# EasyEDA Pro project li-chuang-kai-fa-ban-li-chuang-coloreasypico2-kai-fa-ban-7911d14e.epro, board PCB1_V1.0.4
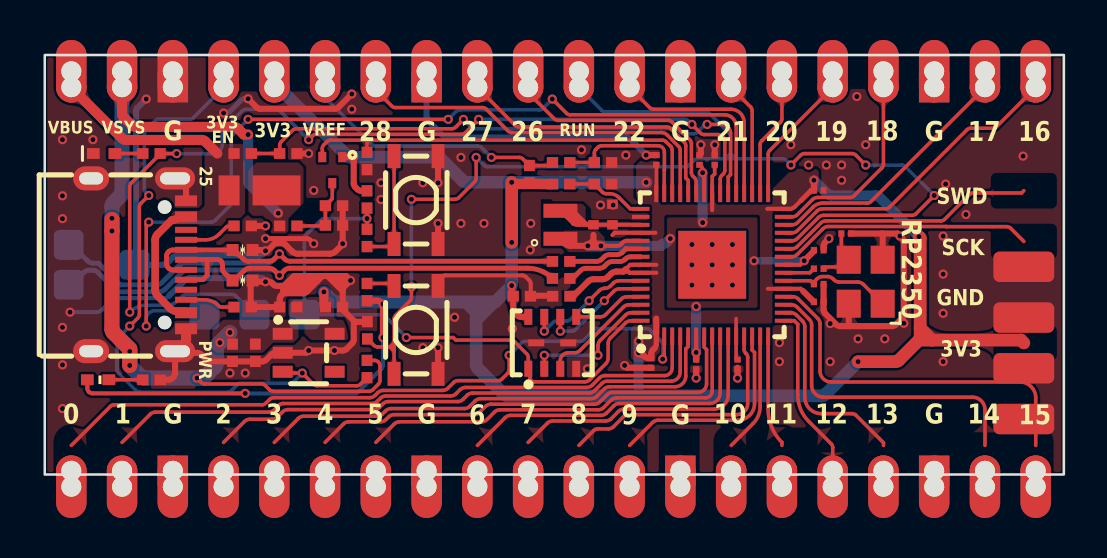
[diagram p1: board, top side]
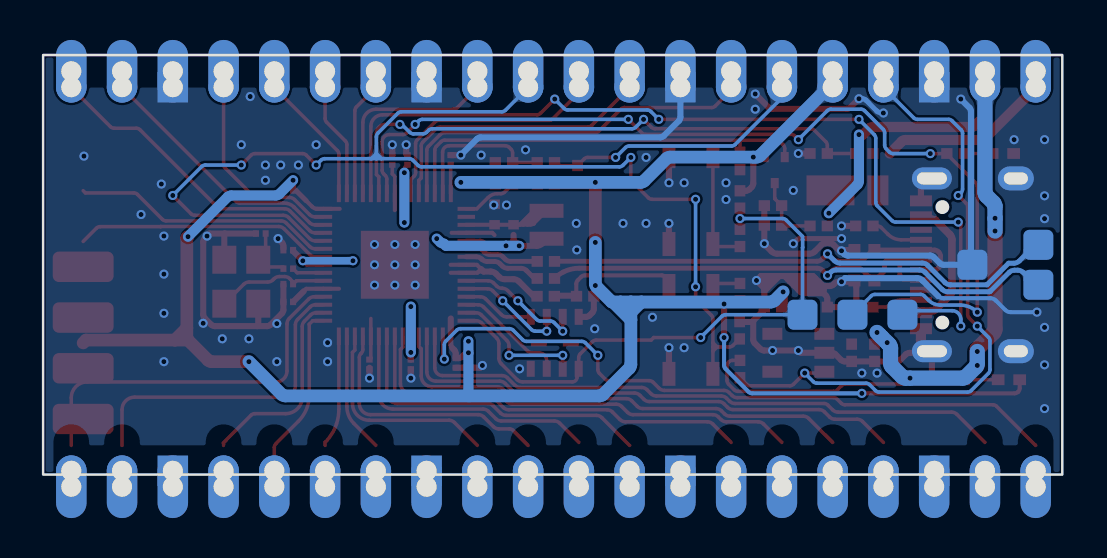
[diagram p2: board, bottom side, seen from below]

Outline 51 x 21 mm; copper layers: Top Layer, Bottom Layer. Coordinates in mm from the lower left corner of the outline.
Outline path: rectangle 0,21 51,0
Stack: Top Layer 0.035mm / Dielectric1 1.51mm FR4 er 4.5 / Bottom Layer 0.035mm

## Design rules (mm)
net USB_D-: DP2
net USB_D+: DP2
net USB2_D+: DP3
net USB2_D-: DP3
spacing copperThickness1oz (default): track to track 0.102, other pairs 0 to 0.3
spacing copperThickness2oz: track to track 0.203, other pairs 0.152 to 0.3
spacing Plane_innerPlane: track to track 0.102, other pairs 0 to 0.3
spacing Copper_copperRegion: track to track 0.102, other pairs 0 to 0.3
track width copperThickness1oz (default): min 0.102, default 0.178, max 2.54
track width VCC: min 0.102, default 0.305, max 2.54
differential pair differentialPair (default): width min 0.244, default 0.244, max 0.244; gap min 0.102, default 0.102
net GND uses VCC
net 3V3 uses VCC
net 1V1 uses VCC
pour e1417 uses Copper_copperRegion
pour e1419 uses Copper_copperRegion
pour e1421 uses Copper_copperRegion
pour e1423 uses Copper_copperRegion
pour e1425 uses Copper_copperRegion
pour e1427 uses Copper_copperRegion
pour e1429 uses Copper_copperRegion
pour e1431 uses Copper_copperRegion
pour e1433 uses Copper_copperRegion
pour e1435 uses Copper_copperRegion
pour e1437 uses Copper_copperRegion
pour e1439 uses Copper_copperRegion
pour e1441 uses Copper_copperRegion
pour e1443 uses Copper_copperRegion
pour e1445 uses Copper_copperRegion
pour e1451 uses Copper_copperRegion

## Placement (name value [footprint] x y rotation side)
BOOT1  K2-1808SN-A4SW-01  [KEY-SMD_4P-L4.2-W3.2-P2.20-LS5.1-TL]  18.58 13.74 90 top
C1  4.7uF  [C0402]  27.46 12.5 270 top
C2  100nF  [R0402]  25.85 8.93 180 top
C3  4.7uF  [C0402]  28.41 12.5 90 top
C4  4.7uF  [R0402]  27.94 14.54 0 top
C5  100nF  [R0201]  38.74 14.22 180 top
C6  100nF  [R0201]  30.61 15.75 90 top
C7  100nF  [R0402]  16.15 7.22 270 top
C8  4.7uF  [R0402]  27.94 15.62 0 top
C9  100nF  [R0201]  38.74 11.23 0 top
C10  10uF  [R0402]  14.48 8.38 180 top
C11  100nF  [R0402]  12.19 8.38 0 top
C12  10uF  [R0402]  9.4 6.1 90 top
C13  100nF  [R0402]  10.54 6.1 90 top
C14  100nF  [R0201]  38.74 8.64 0 top
C15  100nF  [R0201]  33.53 15.75 270 top
C16  100nF  [R0201]  32.77 15.75 270 top
C17  100nF  [R0201]  34.67 5.51 270 top
C18  100nF  [R0201]  32.6 5.51 270 top
C19  100nF  [R0201]  30.35 5.59 270 top
C21  100nF  [R0402]  14.48 12.48 180 top
C22  15pF  [R0201]  38.74 9.53 180 top
C23  15pF  [R0201]  40.11 12.06 0 top
C24  100nF  [R0402]  23.88 8.93 180 top
D1  DFLS130L-7  [POWERDI-123_L2.8-W1.8-LS3.7-RD]  10.41 14.22 180 top
D2  RCLAMP0521P.TCT-MS  [D0402-BI]  9.9 11.24 180 top
D3  RCLAMP0521P.TCT-MS  [D0402-BI]  9.9 9.72 180 top
H1  2.54-1*4  [HDR-TH_4P-P2.54-V-M-1]  49 10.4 270 top
J1  -  [半孔-孔-20P-2.54-1.27-无丝印#2]  25.46 0 0 top
J2  -  [半孔-孔-20P-2.54-1.27-无丝印]  25.46 21 0 top
L2  AOTA-B201610S3R3-101-T  [IND-SMD_L2.0-W1.6_AOTA-B201610S3R3-101-T]  25.81 12.5 90 top
LED1  XL-1005UGC  [LED0402-RD_GREEN]  2.97 16.07 0 top
PWR_LED  NCD0402R1  [LED0402-RD]  2.67 4.75 180 top
Q1  DMG1012T-7  [SOT-523-3_L1.6-W0.8-P1.00-LS1.6-BR]  14.39 15.24 90 top
R1  15kΩ  [R0402]  5.34 16.07 180 top
R2  5.1kΩ  [R0402]  9.91 12.45 0 top
R3  5.6kΩ  [R0402]  9.91 16.07 180 top
R4  27Ω  [R0402]  25.84 10.67 0 top
R5  27Ω  [R0402]  25.84 9.82 0 top
R6  10kΩ  [R0402]  12.19 16.07 180 top
R7  33Ω  [R0402]  25.84 14.54 180 top
R8  5.1kΩ  [R0402]  9.91 8.38 0 top
R9  10kΩ  [R0402]  16.13 9.13 90 top
R10  1Ω  [R0402]  25.84 15.62 180 top
R11  100kΩ  [R0402]  16.13 5.28 270 top
R12  2kΩ  [R0402]  5.34 4.75 0 top
R13  NC  [R0402]  16.13 13.77 90 top
R14  1kΩ  [R0402]  16.13 11.84 90 top
R15  100kΩ  [R0402]  12.19 12.45 180 top
R16  100kΩ  [R0402]  14.48 13.46 180 top
R17  100kΩ  [R0402]  16.13 15.7 90 top
R18  1kΩ  [R0201]  38.74 10.31 0 top
R19  200Ω  [R0402]  24.26 15.04 270 top
SW1  K2-1808SN-A4SW-01  [KEY-SMD_4P-L4.2-W3.2-P2.20-LS5.1-TL]  18.58 7.24 90 top
TP1  TP-红色测试点  [TESTPOINT-TH_BD3.2]  4.5 10.5 270 bottom
TP2  TP-红色测试点  [TESTPOINT-TH_BD3.2]  1.2 11.5 0 bottom
TP3  TP-红色测试点  [TESTPOINT-TH_BD3.2]  1.2 9.5 0 bottom
TP4  TP-红色测试点  [TESTPOINT-TH_BD3.2]  8 8 270 bottom
TP5  TP-红色测试点  [TESTPOINT-TH_BD3.2]  10.5 8 270 bottom
TP6  TP-红色测试点  [TESTPOINT-TH_BD3.2]  13 8 270 bottom
U1  RP2350A  [QFN-60_L7.0-W7.0-P0.40-TL-EP3.4]  33.4 10.5 90 top
U3  ME6217C33M5G  [SOT-23-5_L3.0-W1.7-P0.95-LS2.8-BR]  13.21 6.1 180 top
U4  W25Q32JVUUIQ  [USON-8_L4.0-W3.0-P0.80-BL_WINBOND_UU]  25.4 6.59 0 top
USB1  TYPE-C 16PIN 2MD(073)  [USB-C-SMD_TYPE-C-6PIN-2MD-073]  4.7 10.5 270 top
X1  ABM8-272-T3  [CRYSTAL-SMD_4P-L3.2-W2.5-BL]  41.08 9.65 90 top

## Footprints (pads in the part's own frame, mm; a bottom-side part is the same pattern mirrored in y, then rotated)
C0402
  rect 0.47x0.531 smd: 1(0,0) 2(1.031,0)
CRYSTAL-SMD_4P-L3.2-W2.5-BL
  rect 1.4x1.2 smd: 1(-1.1,-0.85) 2(1.1,-0.85) 3(1.1,0.85) 4(-1.1,0.85)
D0402-BI
  rect 0.6x0.6 smd: 1(-0.5,0) 2(0.5,0)
HDR-TH_4P-P2.54-V-M-1
  rrect 1.524x3.048 smd: 1(0,0) 2(2.54,0) 3(5.08,0) 4(7.62,0)
IND-SMD_L2.0-W1.6_AOTA-B201610S3R3-101-T
  rect 0.7x1.7 smd: 1(0.7,0) 2(-0.7,0)
KEY-SMD_4P-L4.2-W3.2-P2.20-LS5.1-TL
  rect 1.2x0.65 smd: 1(-2.2,1.1) 2(2.2,1.1) 3(-2.2,-1.1) 4(2.2,-1.1)
LED0402-RD
  rect 0.636x0.54 smd: 1(-0.538,0) 2(0.538,0)
LED0402-RD_GREEN
  rect 0.636x0.54 smd: 1(-0.538,0) 2(0.538,0)
POWERDI-123_L2.8-W1.8-LS3.7-RD
  rect 2.4x1.5 smd: 1(-1.188,0)
  rect 1.05x1.5 smd: 2(1.188,0)
QFN-60_L7.0-W7.0-P0.40-TL-EP3.4
  rect 0.875x0.2 smd: 1(-3.575,2.8) 2(-3.575,2.4) 3(-3.575,2) 4(-3.575,1.6) 5(-3.575,1.2) 6(-3.575,0.8) 7(-3.575,0.4) 8(-3.575,0) 9(-3.575,-0.4) 10(-3.575,-0.8) 11(-3.575,-1.2) 12(-3.575,-1.6) 13(-3.575,-2) 14(-3.575,-2.4) 15(-3.575,-2.8) 31(3.575,-2.8) 32(3.575,-2.4) 33(3.575,-2.001) 34(3.575,-1.6) 35(3.575,-1.2) 36(3.575,-0.8) 37(3.575,-0.4) 38(3.575,-0.001) 39(3.575,0.4) 40(3.575,0.8) 41(3.575,1.2) 42(3.575,1.6) 43(3.575,2) 44(3.575,2.4) 45(3.575,2.8)
  rect 0.2x0.875 smd: 16(-2.8,-3.575) 17(-2.4,-3.575) 18(-2,-3.575) 19(-1.6,-3.575) 20(-1.2,-3.575) 21(-0.8,-3.575) 22(-0.4,-3.575) 23(0,-3.575) 24(0.4,-3.575) 25(0.8,-3.575) 26(1.2,-3.575) 27(1.6,-3.575) 28(2,-3.575) 29(2.4,-3.575) 30(2.8,-3.575) 46(2.8,3.575) 47(2.4,3.575) 48(2,3.575) 49(1.6,3.575) 50(1.2,3.575) 51(0.8,3.575) 52(0.4,3.575) 53(0,3.575) 54(-0.4,3.575) 55(-0.8,3.575) 56(-1.2,3.575) 57(-1.6,3.575) 58(-2,3.575) 59(-2.4,3.575) 60(-2.8,3.575)
  rect 3.4x3.4 smd: 61(0,0)
R0201
  rect 0.303x0.324 smd: 1(-0.241,0) 2(0.241,0)
R0402
  rect 0.566x0.54 smd: 1(-0.433,0) 2(0.433,0)
SOT-23-5_L3.0-W1.7-P0.95-LS2.8-BR
  rect 1x0.6 smd: 1(1.3,-0.95) 2(1.3,0) 3(1.3,0.95) 4(-1.3,0.95) 5(-1.3,-0.95)
SOT-523-3_L1.6-W0.8-P1.00-LS1.6-BR
  rect 0.51x0.4 smd: 1(0.65,-0.5) 2(0.65,0.5) 3(-0.65,0)
TESTPOINT-TH_BD3.2
  rrect 1.5x1.5 smd: 1(0,0)
USB-C-SMD_TYPE-C-6PIN-2MD-073
  rect 0.55x1.1 smd: 1(-3.2,2.375) 2(-2.4,2.375) 11(2.4,2.375) 12(3.2,2.375)
  rect 0.3x1.1 smd: 3(-1.75,2.375) 4(-1.25,2.375) 5(-0.75,2.375) 6(-0.25,2.375) 7(0.25,2.375) 8(0.75,2.375) 9(1.25,2.375) 10(1.75,2.375)
  oval 1.1x2 hole 0.6x1.5: 13(-4.325,1.825) 14(4.325,1.825)
  oval 1.2x1.8 hole 0.6x1.2: 13(-4.325,-2.375) 14(4.325,-2.375)
USON-8_L4.0-W3.0-P0.80-BL_WINBOND_UU
  rect 0.4x0.8 smd: 1(-1.2,-1.3) 2(-0.4,-1.3) 3(0.4,-1.3) 4(1.2,-1.3) 5(1.2,1.3) 6(0.4,1.3) 7(-0.4,1.3) 8(-1.2,1.3)
  rect 0.8x0.35 smd: 9(-0.802,0) 10(0.798,0)
半孔-孔-20P-2.54-1.27-无丝印
  oval 1.524x3.136 hole 1: 1(-24.13,-0.813) 2(-21.59,-0.813) 3(-19.05,-0.813) 4(-16.51,-0.813) 5(-13.97,-0.813) 6(-11.43,-0.813) 7(-8.89,-0.813) 8(-6.35,-0.813) 9(-3.81,-0.813) 10(-1.27,-0.813) 11(1.27,-0.813) 12(3.81,-0.813) 13(6.35,-0.813) 14(8.89,-0.813) 15(11.43,-0.813) 16(13.97,-0.813) 17(16.51,-0.813) 18(19.05,-0.813) 19(21.59,-0.813) 20(24.13,-0.813)
  round 1.524 hole 1: 1(-24.13,-1.61) 2(-21.59,-1.61) 4(-16.51,-1.61) 5(-13.97,-1.61) 6(-11.43,-1.61) 7(-8.89,-1.61) 9(-3.81,-1.61) 10(-1.27,-1.61) 11(1.27,-1.61) 12(3.81,-1.61) 14(8.89,-1.61) 15(11.43,-1.61) 16(13.97,-1.61) 17(16.51,-1.61) 19(21.59,-1.61) 20(24.13,-1.61)
  rect 1.524x1.524 hole 1: 3(-19.05,-1.61) 8(-6.35,-1.61) 13(6.35,-1.61) 18(19.05,-1.61)
半孔-孔-20P-2.54-1.27-无丝印#2
  round 1.524 hole 1: 1(-24.13,0.188) 2(-21.59,0.188) 4(-16.51,0.188) 5(-13.97,0.188) 6(-11.43,0.188) 7(-8.89,0.188) 9(-3.81,0.188) 10(-1.27,0.188) 11(1.27,0.188) 12(3.81,0.188) 14(8.89,0.188) 15(11.43,0.188) 16(13.97,0.188) 17(16.51,0.188) 19(21.59,0.188) 20(24.13,0.188)
  oval 1.524x3.136 hole 1: 1(-24.13,-0.61) 2(-21.59,-0.61) 3(-19.05,-0.61) 4(-16.51,-0.61) 5(-13.97,-0.61) 6(-11.43,-0.61) 7(-8.89,-0.61) 8(-6.35,-0.61) 9(-3.81,-0.61) 10(-1.27,-0.61) 11(1.27,-0.61) 12(3.81,-0.61) 13(6.35,-0.61) 14(8.89,-0.61) 15(11.43,-0.61) 16(13.97,-0.61) 17(16.51,-0.61) 18(19.05,-0.61) 19(21.59,-0.61) 20(24.13,-0.61)
  rect 1.524x1.524 hole 1: 3(-19.05,0.188) 8(-6.35,0.188) 13(6.35,0.188) 18(19.05,0.188)

## Nets
As in the schematic.

Pads without a net: U3 4; USB1 3 9

## Via types
v1: diameter 0.457, hole 0.254, Top Layer to Bottom Layer, 149 vias

## Routing (per net, layer and track width the routed paths; a pad name or vN(x,y) marks a point on that pad's centre or on a via; arc(x,y) is an arc through that point)
1V1: length 20.5
  Top Layer w0.203: C16.2 32.85,15.42 arc(32.91,15.34) 32.93,15.24 v1(32.93,15.11) 33,15.03 U1.39 ; 27.69,11.45 28.66,11.45 arc(28.76,11.47) 28.84,11.52 28.94,11.63 arc(29.03,11.68) 29.12,11.7 29.83,11.7 ; v1(38.01,10.7) 37.81,10.5 U1.23 ; v1(32.6,6.11) U1.6
  Top Layer w0.305: C9.1 38.49,11.19 v1(38.01,10.7) ; 27.46,12 27.46,11.73 27.29,11.56 arc(27.17,11.48) 27.02,11.45 26.3,11.45 arc(26.15,11.48) 26.03,11.56 25.81,11.78 ; C18.1 v1(32.6,6.11)
  Bottom Layer w0.381: v1(38.01,10.7) v1(35.5,10.7)
  Bottom Layer w0.508: v1(32.93,15.11) v1(32.93,12.61) ; 27.84,11.45 27.83,11.45 v1(27.18,11.45) ; v1(27.84,11.45) 30.84,11.45 30.95,11.56 arc(31.04,11.58) 31.13,11.63 v1(31.31,11.81) ; v1(32.6,8.41) v1(32.6,6.11)
3V3: length 136.9
  Top Layer w0.178: 33.4,14.19 33.4,14.92 33.53,15.05 C15.2 ; C17.1 34.6,5.82 34.6,7.81 ; C6.1 30.61,14.08 U1.45 ; 30.6,7.03 30.61,7.03
  Top Layer w0.201: 29.83,12.1 30.56,12.1
  Top Layer w0.203: 30.61,10.1 U1.54 29.27,10.1 29.21,10.16 ; 29.21,10.16 28.96,10.16 ; 29.21,10.16 29.08,10.29 29.3,10.5 U1.53 30.61,10.5 ; 37.85,13.72 37.54,13.41 arc(37.42,13.33) 37.27,13.3 U1.30 36.16,13.3 ; U1.38 33.4,13.23 ; 29.83,12.1 28.52,12.1 28.41,11.99 ; v1(10.03,4.06) 2.39,4.06 arc(2.29,4.08) 2.21,4.14 2.21,4.14 arc(2.15,4.23) 2.13,4.32 2.13,4.75 ; 37.96,9.17 37.83,9.3 U1.20 36.19,9.3
  Top Layer w0.254: C5.2 38.35,14.22 37.85,13.72 ; 30.6,7.03 30.6,6.51 arc(30.58,6.42) 30.53,6.33
  Top Layer w0.305: 30.6,7.03 30.6,7.81 ; 16.93,6.89 16.93,8.43 arc(16.91,8.53) 16.85,8.61 16.84,8.63 arc(16.76,8.68) 16.66,8.7 R9.1 ; 16.93,6.89 v1(16.93,6.86) ; 16.93,6.89 16.89,6.86 ; 13.97,8.46 14.04,8.38 ; v1(23.37,9.46) 23.37,9.03 23.44,8.95 23.44,8.28 arc(23.46,8.19) 23.52,8.11 23.66,7.97 arc(23.74,7.91) 23.84,7.89 U4.8 ; 37.96,9.17 38.49,8.64 ; 29.08,10.29 28.96,10.16 28.61,10.16 arc(28.46,10.13) 28.34,10.05 28.18,9.89 arc(28.05,9.81) 27.91,9.78 27.46,9.78 arc(27.32,9.75) 27.19,9.67 26.45,8.93 C2.1 ; R13.2 15.83,14.2 arc(15.74,14.22) 15.66,14.28 15.54,14.4 arc(15.48,14.48) 15.46,14.58 15.46,15.64 arc(15.44,15.73) 15.39,15.82 arc(15.31,15.87) 15.21,15.89 Q1.1 ; 30.53,6.33 30.43,6.23 arc(30.37,6.15) 30.35,6.05 C19.1 30.21,5.83 arc(30.11,5.85) 30.03,5.9 29.94,5.99 29.82,5.99 v1(29.72,6.1) ; C5.2 v1(38.49,14.73)
  Top Layer w0.457: v1(13.97,9.14) 13.97,8.46
  Top Layer w0.508: v1(23.37,14.63) 23.45,14.54 R7.2
  Top Layer w0.635: 44.41,6.73 48.85,6.73 49,6.59 ; 44.41,6.73 43.75,6.73 ; 44.41,6.73 43.81,7.33 ; v1(23.37,14.63) v1(23.37,11.62) ; 43.75,6.73 43.81,6.79 43.81,7.33 ; 43.75,6.73 42.75,5.73 arc(42.66,5.67) 42.57,5.65 v1(40.7,5.65) ; v1(43.75,11.91) 43.81,11.85 43.81,7.33
  Bottom Layer w0.203: v1(16.93,6.86) 16.93,5.47 arc(16.91,5.38) 16.85,5.29 15.7,4.14 arc(15.61,4.08) 15.52,4.06 v1(10.03,4.06)
  Bottom Layer w0.508: v1(43.75,11.91) 41.77,13.9 arc(41.68,13.95) 41.59,13.97 39.36,13.97 arc(39.26,13.99) 39.18,14.04 v1(38.49,14.73) ; v1(29.72,6.67) v1(29.72,6.1) 29.72,3.97 29.69,3.94
  Bottom Layer w0.635: v1(30.1,14.63) v1(23.37,14.63) 21.1,14.63 arc(21.01,14.65) 20.92,14.7 19.81,15.82 arc(19.73,15.87) 19.63,15.89 v1(15.46,15.89) 15.3,15.89 arc(15.2,15.91) 15.12,15.96 11.79,19.3 arc(11.71,19.35) 11.61,19.37 11.49,19.37 ; 21.59,8.12 21.59,7.75 ; 21.59,8.12 21.59,8.63 21.59,8.64 ; 21.59,8.12 22.11,8.64 ; 21.59,8.12 21.07,8.64 ; 21.59,7.75 21.59,5.5 arc(21.61,5.41) 21.66,5.32 22.98,4.01 arc(23.06,3.96) 23.16,3.94 38.88,3.94 arc(38.98,3.96) 39.06,4.01 v1(40.7,5.65) ; 21.59,7.75 22.48,8.64 ; 22.11,8.64 22.48,8.64 ; 22.11,8.64 21.59,8.64 ; 21.07,8.64 14.58,8.64 arc(14.49,8.66) 14.4,8.71 v1(13.97,9.14) ; 21.07,8.64 21.59,8.64 ; 22.48,8.64 22.54,8.64 23.29,9.39 arc(23.35,9.47) 23.37,9.57 v1(23.37,11.62)
  vias: v1(16.93,8.54)
3V3_EN: length 32.3
  Top Layer w0.178: R11.2 15.8,4.52 arc(15.72,4.46) 15.62,4.44 13.63,4.44 arc(13.53,4.46) 13.45,4.52 12.97,5.01 arc(12.88,5.06) 12.79,5.08 11.97,5.08 U3.3 ; v1(5.21,13.97) 4.81,13.57 arc(4.76,13.49) 4.74,13.39 4.74,8.02 arc(4.72,7.92) 4.66,7.84 v1(4.25,7.43)
  Bottom Layer w0.178: v1(12.89,5.08) 12.46,4.65 arc(12.37,4.59) 12.28,4.57 9.82,4.57 arc(9.72,4.55) 9.64,4.5 9.35,4.2 arc(9.26,4.15) 9.17,4.13 4.74,4.13 arc(4.64,4.15) 4.56,4.2 3.69,5.07 arc(3.64,5.15) 3.62,5.25 3.62,6.69 arc(3.64,6.79) 3.69,6.87 v1(4.25,7.43) ; v1(5.21,13.97) 5.07,14.11 arc(5.01,14.19) 4.99,14.29 4.99,17.08 arc(5.01,17.18) 5.07,17.26 5.51,17.71 arc(5.6,17.76) 5.69,17.78 7.25,17.78 arc(7.35,17.8) 7.43,17.85 8.95,19.37
GND: length 123.7
  Top Layer w0.203: 19.68,9.44 19.68,9.61 arc(19.7,9.71) 19.76,9.79 19.86,9.89 arc(19.95,9.95) 20.04,9.97 23.9,9.97 arc(24,9.95) 24.08,9.89 24.25,9.73 arc(24.3,9.64) 24.32,9.55 24.32,8.97 24.31,8.95
  Top Layer w0.254: v1(11.05,11.81) 13.1,11.81 arc(13.2,11.79) 13.28,11.74 v1(13.46,11.56)
  Top Layer w0.305: 11.94,9.08 12.93,9.08 arc(13.03,9.1) 13.11,9.15 13.2,9.24 ; 11.94,9.08 11.83,8.97 arc(11.78,8.88) 11.76,8.79 11.76,8.64 arc(11.68,8.46) 11.5,8.38 R8.2 10.31,8.41 10.31,9.4 arc(10.38,9.58) 10.56,9.65 v1(11.05,9.65) 11.21,9.65 arc(11.3,9.63) 11.38,9.58 11.45,9.51 arc(11.53,9.46) 11.63,9.44 11.97,9.44 ; 11.94,9.08 11.94,9.26 ; C6.2 v1(30.1,15.99) ; C16.1 32.83,16.06 v1(32.83,16.51) ; 14.91,9.47 14.6,9.78 ; 14.91,9.47 14.91,9.55 ; 14.91,9.47 14.91,9.32 ; C19.2 29.13,5.35 v1(29.02,5.46) ; 14.16,9.94 15.08,9.94 ; 14.16,9.94 13.89,9.94 ; 14.16,9.94 14.91,9.18 ; 15.08,9.94 14.99,9.84 arc(14.93,9.76) 14.91,9.66 14.91,9.55 ; 15.08,9.94 v1(15.3,9.72) ; 38.98,9.51 C14.2 38.98,8.25 arc(39,8.15) 39.05,8.07 39.61,7.5 arc(39.7,7.45) 39.79,7.43 40.28,7.43 ; USB1.1 7.07,14.28 arc(6.91,14.66) USB1.13 ; X1.2 41.93,12.05 41.92,12.06 ; 12.01,9.48 12.18,9.65 12.19,9.65 12.36,9.82 ; 12.01,9.48 13.43,9.48 ; 12.01,9.48 11.97,9.44 ; 13.43,9.48 13.2,9.24 ; 13.43,9.48 13.62,9.66 ; 13.2,9.24 13.17,9.26 11.94,9.26 ; 12.36,9.82 12.44,9.74 arc(12.53,9.68) 12.62,9.66 13.62,9.66 ; 12.36,9.82 12.48,9.94 13.58,9.94 ; 14.91,9.18 14.91,9.32 ; 14.91,9.18 C10.1 14.91,8.25 15.47,7.7 ; 14.91,9.32 v1(15.3,9.72) ; 13.58,9.94 13.89,9.94 ; 13.58,9.94 13.74,9.78 13.89,9.94 ; 13.62,9.66 13.74,9.78 ; 15.47,7.7 15.47,6.75 arc(15.45,6.66) 15.39,6.57 15.1,6.28 arc(15.02,6.23) 14.92,6.21 v1(14.5,6.21) v1(13.21,6.21) 13.09,6.1 11.53,6.1 arc(11.44,6.08) 11.36,6.02 11.07,5.74 arc(10.99,5.68) 10.89,5.66 C13.1 C12.1 8.28,5.66 arc(8.19,5.68) 8.11,5.74 7.83,6.01 arc(7.75,6.07) 7.65,6.09 6.52,6.09 6.52,5.07 arc(6.5,4.98) 6.45,4.89 6.38,4.82 arc(6.29,4.76) 6.2,4.75 R12.2 ; 15.47,7.7 15.53,7.64 16.17,7.64 ; 38.98,11.3 38.98,11.44 arc(39,11.54) 39.05,11.62 v1(39.24,11.81) ; C23.2 41.92,12.06 ; 41.92,12.06 42.67,12.06 v1(42.8,11.94) 42.91,11.82 arc(42.97,11.74) 42.99,11.64 42.99,8.01 arc(42.97,7.91) 42.91,7.83 42.59,7.5 arc(42.51,7.45) 42.41,7.43 40.28,7.43 ; C18.2 v1(32.6,4.83) ; 11.97,9.44 11.94,9.41 11.94,9.26 ; X1.4 40.23,7.48 40.28,7.43 ; v1(15.3,9.72) 15.18,9.72 arc(15.08,9.7) 15,9.64 14.91,9.55 ; v1(15.37,19.05) 14.7,18.38 arc(14.61,18.33) 14.52,18.31 10.79,18.31 arc(10.69,18.33) 10.61,18.38 v1(10.18,18.81) ; R6.1 v1(13.21,16.07) ; 34.67,5.35 v1(34.67,4.83) ; R2.2 v1(11.05,12.45) ; 19.69,11.54 v1(19.69,12.57) ; 19.69,11.54 19.69,11.41 ; 19.69,11.54 BOOT1.3 ; 19.68,5.17 v1(19.68,6.35) ; 19.68,11.41 19.69,11.41 ; 19.69,11.41 19.69,11.24 ; 24.31,8.95 25.41,8.95 ; C15.1 v1(33.53,16.51) ; 19.68,15.81 v1(19.68,14.61) ; D2.1 11.01,11.24 v1(11.05,11.2) 11.15,11.2 11.45,11.51 arc(11.53,11.56) 11.63,11.58 11.86,11.58 arc(11.96,11.56) 12.04,11.51 12.38,11.17 arc(12.51,11.08) 12.65,11.05 14.28,11.05 arc(14.42,11.08) 14.55,11.17 14.91,11.53 v1(14.91,11.56) C21.1 R16.1
  Top Layer w0.508: 7.07,7.21 7.07,6.74 arc(7.05,6.65) 7,6.56 6.52,6.09
  Bottom Layer w0.203: v1(1.27,8.13) 2.59,8.13 arc(2.73,8.16) 2.86,8.24 3.33,8.71 arc(3.45,8.8) 3.6,8.83 5.95,8.83 arc(6.09,8.85) 6.22,8.94
  Bottom Layer w0.254: v1(8.95,18.1) 8.98,18.12 9.1,18.12 arc(9.2,18.14) 9.28,18.2 9.82,18.74 arc(9.91,18.79) 10,18.81 v1(10.18,18.81)
  Bottom Layer w0.305: v1(5.08,18.8) 4.65,18.36 arc(4.59,18.28) 4.57,18.18 4.57,10.57 TP1.1 5.95,10.5 arc(6.04,10.52) 6.13,10.58 6.44,10.89 arc(6.52,10.94) 6.62,10.96 10.73,10.96 arc(10.83,10.98) 10.91,11.04 10.91,11.06 v1(11.05,11.2) ; 6.22,8.94 7,9.72 arc(7.12,9.8) 7.27,9.83 10.87,9.83 v1(11.05,9.65) ; 19.11,19.37 19.11,17.89 arc(19.13,17.79) 19.19,17.71 19.94,16.95 arc(20.02,16.9) 20.12,16.88 29.1,16.88 arc(29.2,16.86) 29.28,16.8 v1(30.1,15.99)
  vias: v1(0.89,16.76) v1(0.89,13.95) v1(0.89,12.81) v1(0.89,7.37) v1(0.89,5.49) v1(0.89,3.3) v1(2.41,16.76) v1(9.27,5.08) v1(10.03,5.08) v1(13.46,14.22) v1(15.37,18.29) v1(16.83,14.61) v1(16.83,13.77) v1(18.92,14.61) v1(18.92,6.35) v1(20.51,7.87) v1(20.83,15.88) v1(20.83,12.57) v1(21.98,12.57) v1(23.4,7.3) v1(24.32,12.57) v1(24.3,11.25) v1(26.86,16.26) v1(27.16,5.29) v1(27.81,13.49) v1(28.45,13.49) v1(29.08,15.99) v1(32.38,11.52) v1(32.38,10.5) v1(32.38,9.48) v1(33.4,11.52) v1(33.4,10.5) v1(33.4,9.48) v1(34.42,11.52) v1(34.42,10.5) v1(34.42,9.48) v1(36.77,6.6) v1(36.77,5.65) v1(37.34,16.51) v1(38.23,15.49) v1(39.12,15.49) v1(39.31,7.56) v1(39.31,5.65) v1(39.88,15.49) v1(39.88,14.73) v1(40.64,18.92) v1(40.7,6.79) v1(41.08,16.51) v1(42.04,6.79) v1(42.99,7.57) v1(44.96,11.94) v1(44.96,10.03) v1(44.96,8.07) v1(44.96,5.65) v1(45.09,14.54) v1(46.1,13.02) v1(48.96,15.94)
VBUS: length 15.3
  Top Layer w0.381: USB1.11 6.99,8.18 6.57,8.18 arc(6.43,8.21) 6.3,8.29 5.64,8.96 arc(5.55,9.08) 5.52,9.23 5.52,11.75 arc(5.55,11.9) 5.64,12.02 6.35,12.74 6.46,12.74 arc(6.54,12.79) 6.64,12.81 7.07,12.81
  Top Layer w0.508: 8.64,16.07 8.03,16.67 arc(7.95,16.73) 7.85,16.75 4.06,16.75 arc(3.96,16.77) 3.88,16.82 1.33,19.37
ADC_VREF: length 13.3
  Top Layer w0.178: R10.2 25.33,15.54 arc(25.25,15.49) 25.15,15.47 24.36,15.47 arc(24.26,15.49) 24.18,15.54 23.93,15.8 arc(23.84,15.86) 23.75,15.88 v1(22.35,15.88)
  Bottom Layer w0.178: v1(22.35,15.88) 21.85,16.37 arc(21.77,16.43) 21.68,16.45 16.55,16.45 arc(16.45,16.47) 16.37,16.52 14.11,18.79 arc(14.05,18.87) 14.03,18.97 14.03,19.37
GPIO0: length 34.7
  Top Layer w0.178: 1.33,1.46 3.29,3.42 arc(3.37,3.47) 3.47,3.49 10.88,3.49 arc(10.98,3.51) 11.06,3.57 11.27,3.77 arc(11.35,3.83) 11.45,3.85 16.26,3.85 arc(16.41,3.88) 16.53,3.96 16.67,4.1 arc(16.79,4.18) 16.94,4.21 19.91,4.21 arc(20.06,4.24) 20.18,4.32 20.48,4.62 arc(20.56,4.68) 20.66,4.7 22.69,4.7 arc(22.79,4.72) 22.87,4.77 23.17,5.07 arc(23.22,5.15) 23.24,5.25 v1(23.24,5.97) ; v1(30.92,5.78) 31,5.86 31,7.03
  Bottom Layer w0.178: v1(23.24,5.97) 23.87,6.59 arc(23.95,6.65) 24.04,6.67 26.82,6.67 arc(26.92,6.69) 27,6.74 27.48,7.23 arc(27.57,7.28) 27.66,7.3 30.12,7.3 arc(30.22,7.28) 30.3,7.23 30.85,6.68 arc(30.91,6.6) 30.92,6.5 v1(30.92,5.78)
GPIO1: length 30.6
  Top Layer w0.178: U1.3 31.4,5.34 arc(31.29,5.07) 31.02,4.95 28.04,4.95 arc(27.89,4.92) 27.77,4.84 27.4,4.47 arc(27.27,4.39) 27.13,4.36 21.05,4.36 arc(20.91,4.33) 20.78,4.25 20.58,4.04 arc(20.46,3.96) 20.31,3.93 17.07,3.93 arc(16.92,3.9) 16.8,3.82 16.65,3.67 arc(16.52,3.58) 16.38,3.56 11.92,3.56 arc(11.82,3.54) 11.74,3.48 11.49,3.24 arc(11.37,3.15) 11.22,3.12 5.54,3.12 arc(5.4,3.09) 5.27,3.01 3.87,1.61
GPIO2: length 26
  Top Layer w0.178: 31.8,6.92 31.8,5.14 arc(31.67,4.81) 31.34,4.67 28.15,4.67 arc(28.01,4.65) 27.88,4.56 27.51,4.19 arc(27.39,4.11) 27.24,4.08 21.41,4.08 arc(21.26,4.05) 21.14,3.97 20.94,3.76 arc(20.81,3.68) 20.67,3.65 17.2,3.65 arc(17.05,3.62) 16.93,3.54 16.75,3.36 arc(16.62,3.28) 16.48,3.25 12.17,3.25 arc(12.03,3.22) 11.9,3.14 11.64,2.88 arc(11.52,2.8) 11.37,2.77 10.27,2.77 arc(10.12,2.74) 10,2.66 8.95,1.61
GPIO3: length 24
  Top Layer w0.178: 11.49,1.61 12.69,2.81 arc(12.81,2.89) 12.96,2.92 16.63,2.92 arc(16.78,2.95) 16.9,3.03 17.06,3.19 arc(17.18,3.27) 17.33,3.3 21,3.3 arc(21.15,3.33) 21.27,3.41 21.55,3.69 arc(21.67,3.77) 21.81,3.8 27.36,3.8 arc(27.5,3.83) 27.63,3.91 28,4.28 arc(28.12,4.37) 28.27,4.39 31.54,4.39 arc(31.92,4.55) 32.08,4.93 32.08,6.29 32.2,6.41 32.2,6.92
GPIO4: length 22.7
  Top Layer w0.178: U1.7 33,6.38 33.12,6.26 33.12,4.55 arc(33,4.24) 32.69,4.12 28.42,4.12 arc(28.27,4.09) 28.15,4 27.78,3.63 arc(27.65,3.55) 27.51,3.52 22.32,3.52 arc(22.18,3.49) 22.05,3.41 21.75,3.11 arc(21.63,3.03) 21.48,3 17.48,3 arc(17.33,2.97) 17.21,2.89 17.08,2.75 arc(16.96,2.67) 16.81,2.64 15.22,2.64 arc(15.07,2.61) 14.95,2.53 14.03,1.61
GPIO5: length 20.6
  Top Layer w0.178: U1.8 33.4,4.18 arc(33.3,3.94) 33.06,3.84 28.61,3.84 arc(28.46,3.81) 28.34,3.72 27.97,3.35 arc(27.84,3.27) 27.7,3.24 22.78,3.24 arc(22.63,3.21) 22.51,3.13 22.13,2.75 arc(22.01,2.67) 21.86,2.64 17.76,2.64 arc(17.61,2.61) 17.49,2.53 16.57,1.61
GPIO6: length 16.1
  Top Layer w0.178: 21.65,1.46 23.04,2.85 arc(23.17,2.93) 23.31,2.96 27.84,2.96 arc(27.99,2.99) 28.11,3.07 28.48,3.44 arc(28.6,3.53) 28.75,3.56 33.28,3.56 arc(33.65,3.71) 33.8,4.08 33.8,6.92
GPIO7: length 14
  Top Layer w0.178: 24.19,1.61 25.15,2.57 arc(25.28,2.65) 25.42,2.68 28.08,2.68 arc(28.22,2.71) 28.35,2.79 28.72,3.17 arc(28.84,3.25) 28.99,3.28 33.5,3.28 arc(33.99,3.48) 34.2,3.98 34.2,6.92
GPIO8: length 12.8
  Top Layer w0.178: U1.12 35,6.26 arc(35.02,6.16) 35.08,6.08 35.1,6.05 arc(35.16,5.97) 35.18,5.87 35.18,3.56 arc(35.02,3.16) 34.62,3 29.22,3 arc(29.08,2.97) 28.95,2.89 28.47,2.4 arc(28.34,2.31) 28.2,2.29 27.66,2.29 arc(27.57,2.27) 27.48,2.21 26.73,1.46
GPIO9: length 10.6
  Top Layer w0.178: U1.13 35.4,6.23 35.52,6.11 35.52,3.56 arc(35.27,2.97) 34.68,2.72 30.69,2.72 arc(30.54,2.69) 30.42,2.61 29.27,1.46
GPIO10: length 6
  Top Layer w0.178: 35.8,6.92 35.8,3.41 arc(35.71,2.95) 35.45,2.56 34.35,1.46
GPIO11: length 5.6
  Top Layer w0.178: 36.2,6.92 36.2,3.28 arc(36.23,2.91) 36.32,2.54 arc(36.55,2.04) 36.89,1.61 ; 36.89,1.61 36.89,1.46
GPIO12: length 8.1
  Top Layer w0.178: 39.43,0.83 39.43,1.36 arc(39.41,1.45) 39.36,1.53 38.23,2.66 arc(37.83,3.27) 37.69,3.98 37.69,7.52 37.51,7.7 U1.16
GPIO13: length 10.1
  Top Layer w0.178: U1.17 37.35,8.1 arc(37.49,8.07) 37.62,7.99 37.93,7.68 arc(38.01,7.56) 38.04,7.41 38.04,3.88 arc(38.28,3.29) 38.87,3.05 40.41,3.05 arc(40.51,3.03) 40.59,2.97 41.97,1.59 41.97,1.46
GPIO14: length 16.1
  Top Layer w0.178: U1.18 37.37,8.5 arc(37.52,8.47) 37.64,8.39 38.27,7.76 arc(38.35,7.64) 38.38,7.49 38.38,4.46 arc(38.55,4.05) 38.97,3.87 46.43,3.87 arc(46.87,3.69) 47.05,3.25 47.05,1.46
GPIO15: length 18.7
  Top Layer w0.178: U1.19 37.44,8.9 arc(37.59,8.87) 37.71,8.79 38.69,7.81 arc(38.77,7.69) 38.8,7.54 38.8,5.18 arc(38.96,4.8) 39.34,4.64 48.8,4.64 arc(49.36,4.4) 49.59,3.84 49.59,1.46
GPIO16: length 15.6
  Top Layer w0.178: U1.27 37.4,12.1 arc(37.54,12.13) 37.67,12.21 38.65,13.19 arc(38.77,13.28) 38.92,13.3 42.09,13.3 arc(42.19,13.32) 42.27,13.38 46.15,17.26 arc(46.24,17.32) 46.33,17.34 47.45,17.34 arc(47.55,17.35) 47.63,17.41 49.59,19.37
GPIO17: length 12.9
  Top Layer w0.178: U1.28 37.4,12.5 arc(37.55,12.53) 37.67,12.61 38.43,13.37 arc(38.43,13.37) 38.44,13.38 arc(38.45,13.39) 38.45,13.39 arc(38.61,13.51) 38.8,13.57 arc(38.89,13.59) 38.97,13.59 41.17,13.59 arc(41.26,13.61) 41.34,13.67 47.05,19.37
GPIO18: length 9.9
  Top Layer w0.178: 41.97,19.37 41.97,15.53 arc(41.95,15.44) 41.9,15.35 40.49,13.95 arc(40.41,13.89) 40.31,13.87 38.69,13.87 arc(38.54,13.84) 38.42,13.76 37.67,13.01 arc(37.54,12.93) 37.4,12.9 U1.29
GPIO19: length 6.6
  Top Layer w0.178: 39.43,19.37 36.28,16.22 arc(36.22,16.13) 36.2,16.04 36.2,14.08
GPIO20: length 5.7
  Top Layer w0.178: 35.8,14.08 35.8,16.52 arc(35.82,16.62) 35.88,16.7 36.82,17.64 arc(36.87,17.72) 36.89,17.82 36.89,19.37
GPIO21: length 5.7
  Top Layer w0.178: U1.33 35.4,18.22 arc(35.38,18.31) 35.33,18.4 34.35,19.37
GPIO22: length 10.1
  Top Layer w0.178: U1.34 35,17.62 arc(34.81,18.09) 34.34,18.29 30.46,18.29 arc(30.36,18.31) 30.28,18.36 29.27,19.37
GPIO23: length 46.7
  Top Layer w0.178: v1(5.21,12.64) 5.08,12.51 v1(5.08,7.43) ; v1(25.4,18.8) 26.11,18.08 arc(26.2,18.03) 26.29,18.01 34.02,18.01 arc(34.43,17.84) 34.6,17.43 U1.35 ; v1(10.18,17.78) v1(20.19,17.78)
  Bottom Layer w0.178: v1(5.08,7.43) 5.08,7.77 arc(5.21,8.08) 5.51,8.2 7.8,8.2 TP4.1 ; v1(20.19,17.78) 20.59,18.18 arc(20.67,18.23) 20.77,18.25 24.75,18.25 arc(24.85,18.27) 24.93,18.32 v1(25.4,18.8) ; v1(5.21,12.64) 8.34,12.64 arc(8.44,12.66) 8.52,12.71 9.26,13.45 arc(9.32,13.53) 9.33,13.63 9.33,16.83 arc(9.35,16.93) 9.41,17.01 v1(10.18,17.78)
GPIO24: length 28.6
  Top Layer w0.178: R3.1 11.5,16.07 arc(11.68,16.15) 11.76,16.33 11.76,16.48 arc(11.78,16.58) 11.83,16.66 12.41,17.24 arc(12.49,17.29) 12.59,17.31 20.38,17.31 arc(20.48,17.33) 20.56,17.38 v1(20.96,17.78) ; 34.2,14.08 34.2,14.9 34.32,15.02 34.32,17.08 arc(34.19,17.4) 33.88,17.53 v1(33.15,17.53)
  Bottom Layer w0.178: v1(33.15,17.53) 33.05,17.53 32.65,17.13 arc(32.57,17.08) 32.47,17.06 31.99,17.06 arc(31.89,17.08) 31.81,17.13 31.71,17.24 arc(31.62,17.29) 31.53,17.31 21.53,17.31 arc(21.43,17.33) 21.35,17.38 v1(20.96,17.78)
GPIO25: length 49.3
  Top Layer w0.178: v1(21.72,17.78) 21.04,17.11 arc(20.96,17.05) 20.86,17.03 13.58,17.03 arc(13.48,17.01) 13.4,16.96 v1(13.21,16.76) ; 33.8,14.08 33.8,14.79 arc(33.82,14.88) 33.88,14.97 33.96,15.05 arc(34.02,15.14) 34.04,15.23 34.04,16.66 arc(33.93,16.91) 33.68,17.02 33,17.02 arc(32.9,17.04) 32.82,17.09 v1(32.38,17.53) ; v1(6.6,16.07) 5.78,16.07 R1.1 5.78,16.04 4.33,14.59 arc(4.27,14.51) 4.25,14.42 v1(4.25,8.13)
  Bottom Layer w0.178: v1(32.38,17.53) 32.21,17.71 arc(32.12,17.76) 32.03,17.78 v1(21.72,17.78) ; TP5.1 9.56,8.94 arc(9.48,9) 9.38,9.02 7.09,9.02 arc(6.99,9) 6.91,8.94 6.7,8.73 arc(6.42,8.55) 6.1,8.48 5.11,8.48 arc(4.65,8.39) v1(4.25,8.13) ; v1(13.21,16.76) 11.76,18.21 arc(11.68,18.27) 11.58,18.29 10.07,18.29 arc(9.98,18.27) 9.9,18.21 8.96,17.28 arc(8.91,17.2) 8.89,17.1 8.89,16.49 arc(8.87,16.39) 8.82,16.31 8.65,16.14 arc(8.56,16.08) 8.47,16.07 v1(6.6,16.07)
GPIO26/ADC0: length 12.1
  Top Layer w0.178: 24.19,19.37 24.19,19.22 arc(24.21,19.12) 24.27,19.04 25.5,17.8 arc(25.59,17.75) 25.68,17.73 31.2,17.73 arc(31.3,17.71) 31.38,17.66 32.29,16.75 arc(32.34,16.67) 32.36,16.57 32.36,15.11 arc(32.38,15.02) 32.44,14.93 32.53,14.84 arc(32.58,14.76) 32.6,14.67 U1.40
GPIO27/ADC1: length 14.1
  Top Layer w0.178: 32.2,14.08 32.2,14.73 32.08,14.85 32.08,16.46 arc(32.06,16.55) 32.01,16.64 31.32,17.32 arc(31.23,17.38) 31.14,17.4 23.73,17.4 arc(23.63,17.42) 23.55,17.47 21.65,19.37
GPIO28/ADC2: length 18.8
  Top Layer w0.178: 16.57,19.37 16.57,19.24 17.37,18.44 arc(17.45,18.39) 17.55,18.37 21.91,18.37 arc(22.01,18.35) 22.09,18.3 23.19,17.19 arc(23.27,17.14) 23.37,17.12 30.87,17.12 arc(31.02,17.09) 31.14,17.01 31.73,16.42 arc(31.78,16.34) 31.8,16.24 31.8,14.08
GPIO29/ADC3: length 21.2
  Top Layer w0.178: 16.12,16.74 30.91,16.74 arc(31.01,16.72) 31.09,16.66 31.33,16.42 arc(31.38,16.34) 31.4,16.25 U1.43 ; 16.12,16.74 14.3,16.74 arc(14.21,16.72) 14.12,16.66 13.96,16.5 arc(13.91,16.42) 13.89,16.32 Q1.2 ; 16.12,16.74 16.13,16.73 R17.2
QSPI_SCLK: length 5.6
  Top Layer w0.178: U4.6 v1(25.8,7.18) ; U1.56 28.76,9.3 arc(28.62,9.27) 28.49,9.19 v1(28,8.7)
  Bottom Layer w0.178: v1(25.8,7.18) 26.37,7.18 arc(26.47,7.19) 26.55,7.25 v1(28,8.7)
QSPI_SD0: length 3.6
  Top Layer w0.178: U1.57 29.12,8.9 arc(28.98,8.87) 28.85,8.79 28.07,8 arc(27.95,7.92) 27.8,7.89 U4.5
QSPI_SD1: length 6.7
  Top Layer w0.178: U1.59 29.34,8.1 arc(29.19,8.07) 29.07,7.99 27.8,6.72 arc(27.71,6.59) 27.69,6.45 v1(27.69,5.97) ; U4.2 v1(25,5.97)
  Bottom Layer w0.178: v1(25,5.97) v1(27.69,5.97)
QSPI_SD2: length 5.6
  Top Layer w0.178: U1.58 29.23,8.5 arc(29.09,8.47) 28.96,8.39 26.78,6.21 arc(26.66,6.12) 26.51,6.1 26.19,6.1 arc(26.05,6.07) 25.92,5.98 25.91,5.97 arc(25.83,5.85) 25.8,5.7 U4.3
QSPI_SD3: length 6.5
  Top Layer w0.178: U1.55 28.73,9.7 arc(28.58,9.67) 28.46,9.59 28.31,9.43 arc(28.18,9.35) 28.04,9.32 28.02,9.32 arc(27.88,9.29) 27.75,9.21 v1(27.24,8.7) ; U4.7 v1(25,7.18)
  Bottom Layer w0.178: v1(25,7.18) 25.43,7.61 arc(25.52,7.66) 25.61,7.68 26.12,7.68 arc(26.22,7.7) 26.3,7.76 v1(27.24,8.7)
QSPI_SS: length 29
  Top Layer w0.178: v1(18.1,6.86) 20.45,6.86 20.57,6.73 23.33,6.73 arc(23.42,6.71) 23.51,6.66 24.13,6.04 arc(24.18,5.95) 24.2,5.86 U4.1 24.28,5.21 24.28,4.87 arc(24.35,4.71) 24.51,4.64 27.01,4.64 arc(27.16,4.67) 27.28,4.75 28.08,5.55 arc(28.16,5.68) 28.19,5.82 28.19,6.56 arc(28.22,6.7) 28.31,6.83 29.07,7.59 arc(29.19,7.67) 29.34,7.7 U1.60 ; R13.1 v1(16.13,12.82) R14.2
  Bottom Layer w0.178: v1(18.1,6.86) 17.03,7.93 arc(16.95,7.98) 16.85,8 13.25,8 arc(13.07,8.08) 13,8.25 13,11.35 12.99,11.36 12.99,11.75 13,11.76 13,11.92 13.82,12.74 arc(13.9,12.8) 14,12.82 v1(16.13,12.82)
RUN: length 59.3
  Top Layer w0.178: U1.26 37.39,11.7 arc(37.54,11.73) 37.66,11.81 38.72,12.86 arc(38.84,12.95) 38.98,12.98 43.41,12.98 arc(43.51,13) 43.59,13.05 v1(44.51,13.97) ; v1(18.35,9.4) 18.35,8.87 arc(18.33,8.77) 18.28,8.69 17.56,7.97 arc(17.5,7.89) 17.48,7.79 17.48,6.6 ; 17.48,6.18 17.48,6.39 ; 17.48,6.18 SW1.1 ; 17.48,6.18 17.27,6.39 ; 17.48,6.39 17.48,6.6 ; 17.48,6.39 17.27,6.39 ; v1(21.59,15.88) 21.59,14.83 arc(21.57,14.74) 21.52,14.65 20.72,13.85 arc(20.63,13.8) 20.54,13.78 v1(18.35,13.78) ; 17.48,6.6 17.27,6.39 ; 17.27,6.39 16.66,6.39 arc(16.56,6.41) 16.48,6.46 16.23,6.71 ; v1(41.08,15.49) 40.59,15.99 arc(40.51,16.05) 40.41,16.07 38.01,16.07 arc(37.92,16.05) 37.84,15.99 v1(37.34,15.49)
  Bottom Layer w0.178: v1(21.59,15.88) 21.99,15.48 arc(22.07,15.42) 22.16,15.41 32.06,15.41 arc(32.16,15.42) 32.24,15.48 32.5,15.74 arc(32.58,15.79) 32.68,15.81 34.07,15.81 ; 34.32,16.07 34.58,15.81 ; 34.32,16.07 34.32,15.81 ; 34.32,16.07 34.32,16.07 ; 34.58,15.81 36.92,15.81 arc(37.01,15.79) 37.09,15.74 v1(37.34,15.49) 37.25,15.41 ; 34.58,15.81 34.32,15.81 ; 34.07,15.81 34.32,15.81 ; 34.07,15.81 34.32,16.07 ; v1(44.51,13.97) 43.06,15.42 arc(42.98,15.47) 42.88,15.49 v1(41.08,15.49) ; v1(18.35,9.4) v1(18.35,13.78) ; 34.32,16.07 34.32,16.91 arc(34.31,17.01) 34.25,17.09 33.25,18.09 arc(33.17,18.14) 33.07,18.16 28.05,18.16 arc(27.95,18.18) 27.87,18.24 26.73,19.37
SWCLK: length 12.9
  Top Layer w0.178: 49,11.67 48.33,12.33 arc(48.25,12.39) 48.15,12.41 45.12,12.41 45.11,12.42 39.22,12.42 arc(39.07,12.39) 38.95,12.31 37.65,11.01 arc(37.53,10.93) 37.38,10.9 U1.24
SWD: length 13.2
  Top Layer w0.178: 49,14.21 48.88,14.1 46.46,14.1 arc(46.36,14.08) 46.28,14.02 45.03,12.77 arc(44.95,12.72) 44.85,12.7 39.1,12.7 arc(38.95,12.67) 38.83,12.59 37.66,11.41 arc(37.53,11.33) 37.39,11.3 U1.25
USB2_D+: length 33.3
  Top Layer w0.244: 9.4,9.82 9.28,9.82 8.97,10.12 arc(8.92,10.2) 8.9,10.3 8.9,10.51 arc(8.88,10.6) 8.82,10.69 8.82,10.69 arc(8.74,10.74) 8.64,10.76 8.13,10.76 ; 8.13,10.76 7.07,10.76 ; 8.13,10.76 8.13,9.97 7.93,9.76 7.07,9.76 ; D3.2 9.48,9.72 9.99,10.22 arc(10.11,10.3) 10.26,10.33 11.23,10.33 arc(11.38,10.3) 11.5,10.22 v1(11.75,9.97) 12,10.22 arc(12.12,10.3) 12.26,10.33 24.17,10.33 arc(24.59,10.28) 24.97,10.14 arc(25.19,10) 25.39,9.84 arc(25.4,9.83) R5.1
  Bottom Layer w0.244: TP3.1 1.34,9.5 1.96,10.12 arc(2.09,10.2) 2.23,10.23 2.39,10.23 arc(2.54,10.2) 2.66,10.12 3.6,9.18 3.61,9.18 3.64,9.15 5.74,9.15 arc(5.89,9.18) 6.01,9.26 6.88,10.13 arc(7,10.21) 7.15,10.24 11.32,10.24 arc(11.46,10.21) 11.59,10.13 v1(11.75,9.97)
USB2_D-: length 33.5
  Top Layer w0.244: D2.2 9.48,11.24 9.94,10.79 arc(10.06,10.71) 10.2,10.68 11.22,10.68 arc(11.36,10.71) 11.49,10.79 v1(11.75,11.05) 12.01,10.79 arc(12.13,10.71) 12.28,10.68 25.4,10.68 arc(25.4,10.68) R4.1 ; 9.4,11.31 9.33,11.24 6.4,11.24 arc(6.3,11.22) 6.22,11.16 6.17,11.12 arc(6.12,11.04) 6.1,10.94 6.1,10.55 arc(6.12,10.45) 6.17,10.37 6.23,10.31 arc(6.31,10.26) 6.41,10.24 7.07,10.24
  Bottom Layer w0.244: TP2.1 1.34,11.5 2.15,10.69 arc(2.28,10.61) 2.42,10.58 2.69,10.58 ; v1(11.75,11.05) 11.4,10.7 arc(11.27,10.62) 11.13,10.59 7,10.59 arc(6.86,10.56) 6.73,10.47 5.87,9.61 arc(5.74,9.53) 5.6,9.5 3.78,9.5 3.76,9.52 3.74,9.52 2.69,10.58
USB_D+: length 3.9
  Top Layer w0.244: R5.2 26.42,9.82 26.82,10.21 arc(26.94,10.3) 27.09,10.33 27.75,10.33 arc(27.9,10.35) 28.02,10.44 28.14,10.55 arc(28.26,10.63) 28.41,10.66 28.77,10.66 arc(28.92,10.69) 29.04,10.78 29.06,10.79 arc(29.18,10.87) 29.33,10.9 U1.52
USB_D-: length 3.8
  Top Layer w0.244: U1.51 29.09,11.3 29.08,11.29 29.07,11.29 28.9,11.12 arc(28.78,11.04) 28.63,11.01 28.26,11.01 arc(28.12,10.98) 28,10.9 27.88,10.78 arc(27.76,10.7) 27.61,10.67 R4.2
VSYS: length 46.3
  Top Layer w0.178: R11.1 16.51,5.71 arc(16.61,5.7) 16.69,5.64 16.71,5.62 arc(16.76,5.54) 16.78,5.44 16.78,4.71 arc(16.76,4.61) 16.71,4.53 16.41,4.24 arc(16.33,4.18) 16.23,4.17 11.43,4.17 arc(11.34,4.18) 11.25,4.24 11.03,4.46 arc(10.95,4.51) 10.85,4.53 8.02,4.53 arc(7.92,4.55) 7.84,4.61 v1(7.62,4.83)
  Top Layer w0.508: 3.87,19.37 3.87,18.08 arc(3.89,17.98) 3.95,17.9 4.37,17.47 arc(4.45,17.42) 4.55,17.4 9.48,17.4 arc(9.58,17.38) 9.66,17.32 9.97,17.02 v1(10.18,17.02)
  Top Layer w0.762: 3.37,12.77 v1(3.37,12.19) 3.37,7.28 arc(3.38,7.19) 3.44,7.1 4.25,6.29 v1(4.25,6.16) v1(4.25,5.46)
  Bottom Layer w0.508: v1(10.18,17.02) 10.18,14.69 arc(10.2,14.6) 10.25,14.51 v1(11.68,13.08)
  Bottom Layer w0.762: v1(4.25,6.16) 4.25,5.57 arc(4.27,5.47) 4.33,5.39 4.81,4.9 arc(4.9,4.85) 4.99,4.83 v1(7.62,4.83) 7.83,4.83 arc(7.93,4.85) 8.01,4.9 8.52,5.41 arc(8.58,5.49) 8.59,5.59 8.59,6.33 arc(8.61,6.43) 8.67,6.51 v1(8.76,6.6) 9.02,6.86 arc(9.08,6.92) 9.14,6.98 v1(9.27,7.11) ; v1(3.37,12.19) v1(3.37,12.83) 3.37,13.42 arc(3.38,13.52) 3.44,13.6 3.8,13.96 arc(3.85,14.04) 3.87,14.14 3.87,19.37
XIN: length 5.7
  Top Layer w0.178: X1.1 40.96,9.52 arc(40.84,9.61) 40.69,9.64 39.77,9.64 arc(39.62,9.66) 39.5,9.75 39.45,9.8 arc(39.32,9.88) 39.18,9.91 38.92,9.91 arc(38.77,9.88) 38.65,9.8 38.49,9.64 C22.2 38.33,9.7 U1.21
XOUT: length 1.6
  Top Layer w0.178: R18.1 38.29,10.1 U1.22
$1N7955: length 2.7
  Top Layer w0.178: C23.1 39.87,11.23 arc(39.88,11.13) 39.94,11.05 40.06,10.93 arc(40.13,10.75) 40.06,10.57 39.95,10.47 arc(39.86,10.41) 39.77,10.39 38.98,10.39
$1N8040: length 3.6
  Top Layer w0.178: Q1.3 14.39,13.83 14.39,13.83 14.39,13.8 14.12,13.54 arc(14.06,13.45) 14.04,13.36 14.04,12.7 arc(13.97,12.52) 13.79,12.45 R15.1
$1N8088: length 2.6
  Top Layer w0.178: USB1.4 8.06,11.75 arc(8.42,11.82) 8.72,12.03 9.07,12.37 arc(9.15,12.43) 9.25,12.45 R2.1
$1N8089: length 2.5
  Top Layer w0.178: R8.1 8.87,8.38 arc(8.78,8.4) 8.69,8.46 arc(8.37,8.67) 7.98,8.75 USB1.10
$1N8094: length 1.4
  Top Layer w0.178: LED1.2 4.91,16.07
$1N15224: length 8.4
  Top Layer w0.203: 26.98,12.51 27.14,12.51 26.44,13.21 26.28,13.21 26.98,12.51 ; 26.98,12.51 26.76,12.51 ; 25.81,13.21 26.44,12.58 arc(26.52,12.53) 26.62,12.51 26.76,12.51 ; 25.81,13.31 26.28,13.31 ; 26.76,12.51 26.06,13.21 ; 25.81,13.31 26.28,13.31 ; 26.44,12.56 26.45,12.55 ; 27.14,12.5 29.83,12.5
$1N16315: length 4
  Top Layer w0.178: R7.1 27.4,14.54 arc(27.5,14.52) 27.58,14.47 27.91,14.13 arc(28,14.08) 28.09,14.06 28.27,14.06 arc(28.52,14.01) 28.73,13.87 29.3,13.3 U1.46
$1N16648: length 7.5
  Top Layer w0.178: R10.1 27.25,15.62 arc(27.43,15.7) 27.51,15.88 27.51,16.1 arc(27.53,16.2) 27.58,16.28 27.69,16.39 arc(27.77,16.44) 27.87,16.46 30.69,16.46 arc(30.92,16.37) 31.01,16.14 31.01,15.25 31,15.25 U1.44
$1N24312: length 5.6
  Top Layer w0.178: 17.48,15.81 17.48,11.67 arc(17.41,11.49) 17.23,11.41 R14.1
$1N32447: length 1.7
  Top Layer w0.178: 4.91,4.75 PWR_LED.1
$1N32723: length 1.4
  Top Layer w0.178: R9.2 17.48,9.57

## Copper pours and planes (outline as drawn; the poured copper is in the pictures)
1V1 on Top Layer: 35.66,8.35 31.14,8.35 31.14,12.87 35.66,12.87
1V1 on Top Layer: 27.69,12.22 26,12.22 25.81,12.02 25.81,11.55 26.23,11.14 27.94,11.14 28.13,11.33 28.13,11.77
3V3 on Top Layer: 30.61,15.75 29.84,15.75 29.59,15.49 29.59,13.92 30.2,13.31 30.73,13.31 30.73,15.62
3V3 on Top Layer: 30.6,8.08 30.1,8.08 29.34,7.32 29.34,5.84 29.59,5.59 30.54,5.59 30.82,5.86 30.82,7.86
3V3 on Top Layer: 37.42,15.3 36.07,13.95 36.07,13.27 37.53,13.27 38.26,13.99 38.63,13.99 38.74,14.1 38.74,15.18 38.61,15.3
3V3 on Top Layer: 36.46,7.56 30.35,7.56 30.35,13.66 36.46,13.66
3V3 on Top Layer: 13,7.07 13.34,6.73 15.11,6.73 15.24,6.86 15.24,7.49 14.99,7.75 14.6,7.75 14.48,7.87 14.48,8.76 14.35,8.89 12.32,8.89 12.19,8.76 12.19,8 12.45,7.75 12.81,7.75 13,7.56
GND on Top Layer: -1.59,23.11 53.28,23.11 53.28,-2.79 -1.59,-2.79
GND on Top Layer: 30.11,12.91 28.41,12.91 28.41,13.06 27.96,13.06 27.96,12.91 27.46,12.91 27.46,13.71 27.76,14.01 28.51,14.01 29.41,13.11 30.11,13.11
GND on Top Layer: 14.6,8.89 14.48,8.76 14.48,8 14.6,7.87 14.86,7.87 15.24,7.49 15.24,6.86 14.99,6.6 11.44,6.6 11.04,6.21 7.27,6.21 7.21,6.15 7.21,5.58 7.96,4.83 10.67,4.83 11.43,5.59 12.41,5.59 13.42,4.57 15.75,4.57 15.88,4.7 15.88,8.64 15.62,8.89
GND on Bottom Layer: -1.46,23.5 52.9,23.5 52.9,-2.92 -1.46,-2.92
VBUS on Top Layer: 9.88,16.55 8.55,16.55 8,16 8,13.46 7.75,13.21 6.48,13.21 6.35,13.08 6.35,12.57 6.48,12.45 9.4,12.45 10.03,13.08 10.03,16.4
VSYS on Top Layer: 12.45,7.75 8.92,7.75 8.39,7.21 8.39,6.3 8.6,6.1 10.92,6.1 11.43,6.6 12.45,6.6 12.7,6.86 12.7,7.5
VSYS on Top Layer: 12.19,12.82 12.95,13.58 12.95,15.37 12.7,15.62 10.59,15.62 10.19,15.22 10.19,13.17 10.41,12.95 10.91,12.95 11.11,12.75 11.11,12.23 11.28,12.06 12.06,12.06 12.19,12.19
$1N15224 on Top Layer: 30.11,12.4 29.31,12.4 29.26,12.35 27.11,12.35 26.61,12.85 25.21,12.85 25.21,13.55 26.91,13.55 27.21,13.25 27.21,12.8 27.36,12.65 29.26,12.65 29.31,12.6 30.11,12.6

Small or netless copper shapes (teardrops, artwork), in the pictures only: 314 on Top Layer, 67 on Bottom Layer

## Text on the board
Document Layer: 3D预览时请打开彩色丝印选项
Top Silkscreen Layer: VBUS | VSYS | 3V3 | EN | VREF | RUN | PWR | 25 | GND | SWD | SCK | 0 | 1 | G | 2 | 3 | 4 | 28 | 5 | 27 | 6 | 26 | 7 | 8 | 22 | 9 | 10 | 21 | 11 | 20 | 19 | 12 | 18 | 13 | 14 | 17 | 16 | 15 | RP2350
